# Altium project OWL_Ctr_Box.PrjPcb
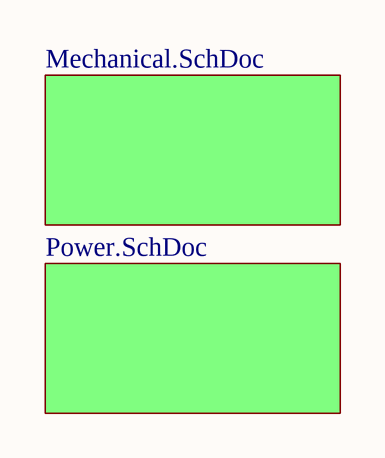
[diagram p0: Block_Diagram.SchDoc]
CurrentRevision: 0.0.0; Partner: EnterPartnerName; Title: [ProjectName]; TitleDraftsman: [ProjectName]; TradeName: EnterTradeName
3 sheets, 5 parts. Net scope: flat (ports and power ports of the same name join across sheets).
Board file: OWL_Ctr_Box.PcbDoc
Sheets:
  Block_Diagram.SchDoc
    U_Mechanical = Mechanical.SchDoc
    U_Power = Power.SchDoc

## Sheet Block_Diagram.SchDoc: [ProjectName]
size 292 x 193 mm; CompanyName: EmbeddedSystems.do; SheetNumber: 1; SheetTotal: 3

### Sub-sheets
U_Mechanical = Mechanical.SchDoc: no entries
U_Power = Power.SchDoc: no entries

### Notes on the sheet
- Title:
- Author:
- Project name:
- Reviewer:
- Approved by:
- Date:
- Part number:
- Revision:
- Page:
- /

## Sheet Mechanical.SchDoc: [ProjectName]
size 292 x 193 mm; CompanyName: EmbeddedSystems.do; SheetNumber: 3; SheetTotal: 3

### Notes on the sheet
- Title:
- Author:
- Project name:
- Reviewer:
- Approved by:
- Date:
- Part number:
- Revision:
- Page:
- /

## Sheet Power.SchDoc: [ProjectName]
size 393 x 281 mm; CompanyName: EmbeddedSystems.do; SheetNumber: 2; SheetTotal: 3; SPICEModelCacheRCKXSCYS: <root> / <DocumentId>RCKXSCYS</DocumentId> / <CacheFrame Number="0"> / <Model Name="fuse" Kind="CKT"> / <Text>.SUBCKT FUSE 1 2 PARAMS: CURRENT=1 RESISTANCE=1m / SW1 1 2 3 0 SMOD OFF / BNLV 3 0 V=(abs(v(1,2))) / .MODEL SMOD SW (VT={(CURRENT*RESISTANCE)} RON=1g ROFF={RESISTANCE}) / .ENDS FUSE</Text> / </Model> / </CacheFrame> / </root>
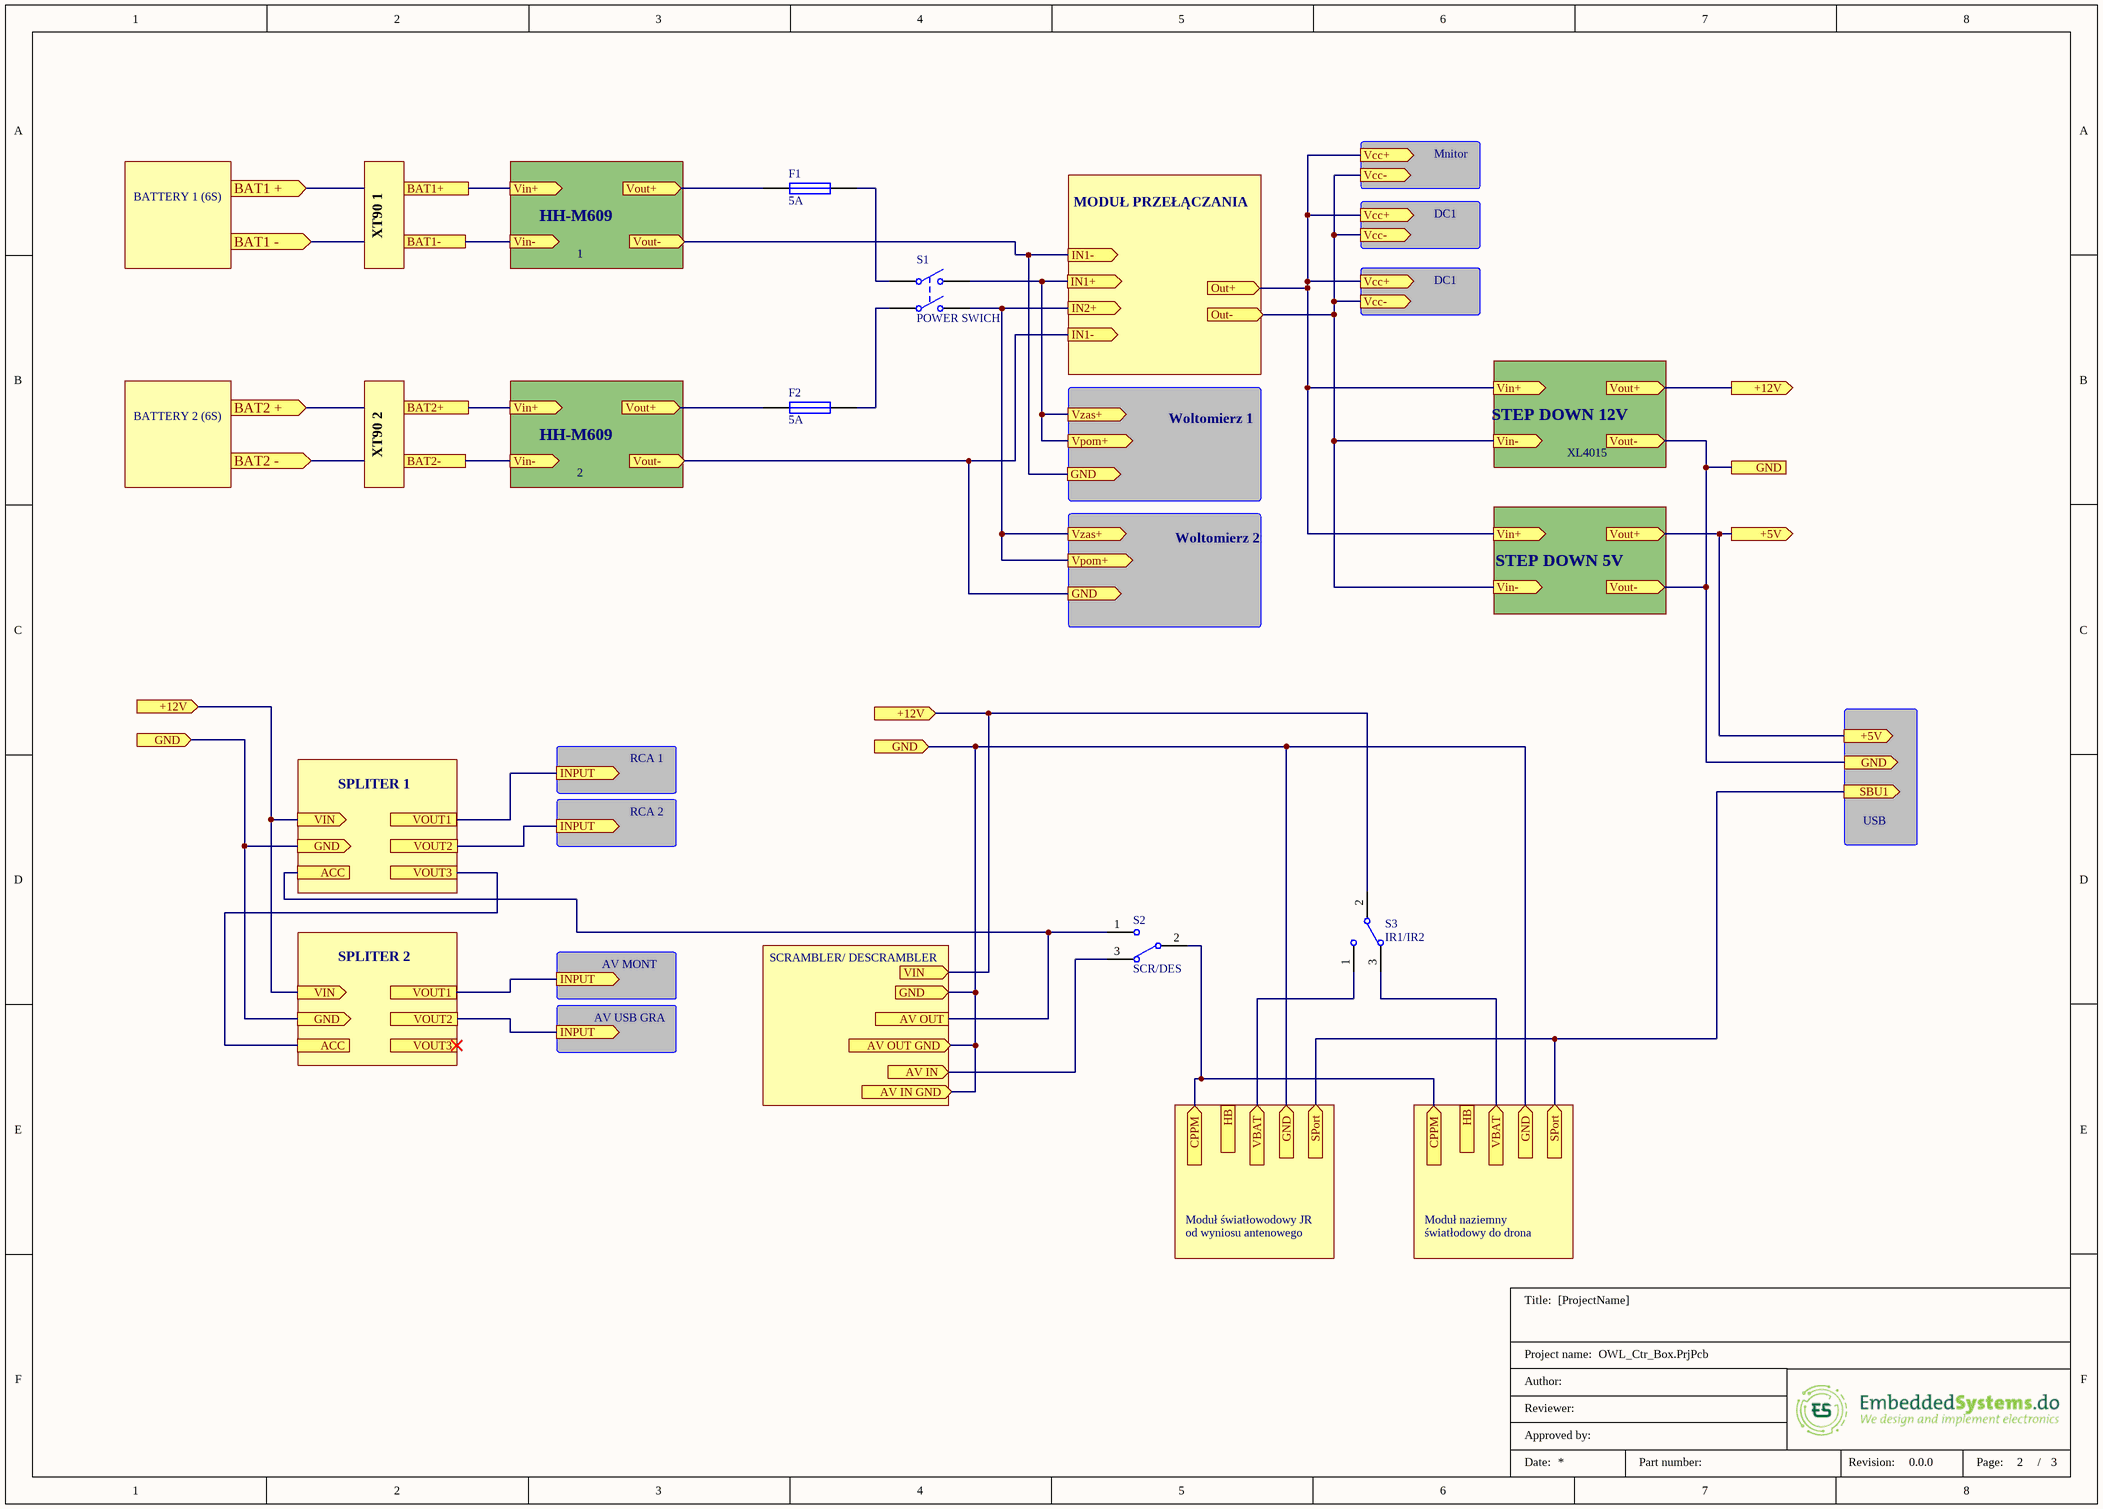
[diagram p1: Power.SchDoc]

### Parts
F1  5A  [PIN-W2/E2.8]
F2  5A  [PIN-W2/E2.8]
S1  POWER SWICH  [DPST-4]
S2  SCR/DES  [TL36WW15050]
S3  IR1/IR2  [TL36WW15050]

### Ports
+5V (out), +12V (in), +12V (out), ACC, AV IN (in), AV IN GND (in), AV OUT (in), AV OUT GND (in), BAT1 + (in), BAT1 - (in), BAT1+, BAT1-, BAT2 + (in), BAT2 - (in), BAT2+, BAT2-, CPPM (in), GND, GND (in), GND (out), HB, HB (in), IN1+ (out), IN1- (out), IN2+ (out), INPUT (out), Out+ (in), Out- (in), SBU1 (out), SPort (in), VBAT (in), Vcc+ (out), Vcc- (out), VIN (in), VIN (out), Vin+ (out), Vin- (out), VOUT1, VOUT2, VOUT3, Vout+ (in), Vout- (in), Vpom+ (out), Vzas+ (out)

### Nets
NetF1_1: F1.1 F2.1 S3.2 ; port Vout+, port +5V, port +12V, port VIN
NetF1_2: F1.2 S1.1(COMMON1)
NetF2_2: F2.2 S1.3(COMMON2)
NetS1_2: S1.2(NO1) S1.4(NO2) ; port IN1+, port IN2+, port Vzas+, port Vpom+
NetS2_1: S2.1 ; port ACC, port VOUT3
NetS2_2: S2.2 ; port CPPM
NetS2_3: S2.3 ; port AV IN
NetS3_1: S3.1 S3.3 ; port VBAT
(unnamed): port BAT1+, port Vin+, port BAT2+, port Out+, port Vcc+
(unnamed): port BAT1-, port Vin-, port BAT2-, port Out-, port Vcc-
(unnamed): port Vout-, port IN1-, port GND, port AV OUT GND, port AV IN GND
(unnamed): port VOUT1, port VOUT2, port INPUT
(unnamed): port SPort, port SBU1

### Notes on the sheet
- Mnitor
- BATTERY 1 (6S)
- XT90 1
- HH-M609
- MODUŁ PRZEŁĄCZANIA
- DC1
- 1
- BATTERY 2 (6S)
- XT90 2
- Woltomierz 1
- STEP DOWN 12V
- 2
- XL4015
- Woltomierz 2
- STEP DOWN 5V
- SPLITER 1
- RCA 1
- RCA 2
- USB
- SPLITER 2
- AV MONT
- SCRAMBLER/ DESCRAMBLER
- AV USB GRA
- Moduł światłowodowy JR
- od wyniosu antenowego
- Moduł naziemny
- światłodowy do drona
- Title:
- Author:
- Project name:
- Reviewer:
- Approved by:
- Date:
- Part number:
- Revision:
- Page:
- /

### Library data of the parts
F1 F2 = Fuse 1: Fuse; Published: 8-Jun-2000; LatestRevisionDate: 17-Jul-2002; LatestRevisionNote: Re-released for DXP Platform.; PackageReference: PIN-W2/E2.8; Publisher: Altium Limited; PackageDescription: Thru-Hole; 2 Leads
S1 = SW-DPST: Double-Pole, Single-Throw Switch; Published: 24-Mar-1999; LatestRevisionDate: 17-Jul-2002; LatestRevisionNote: Re-released for DXP Platform.; PackageReference: DPST-4; Publisher: Altium Limited; PackageDescription: Switch; 4 Leads
S2 S3 = SW-SPDT: SPDT Subminiature Toggle Switch, Right Angle Mounting, Vertical Actuation; Published: 24-Mar-1999; LatestRevisionDate: 17-Dec-2003; LatestRevisionNote: Schematic revised, PCB Footprint replaced.; DatasheetVersion: 05-Dec-2000; PackageReference: TL36WW15050; Publisher: Altium Limited; PackageDescription: Switch; 4 Leads; ComponentLink1Description: Manufacturer Link; ComponentLink1URL: http://www.apem.com